# EAGLE design base-station (EAGLE 8.1.0)
REVISION: v2.0; TEAM: RoboCup
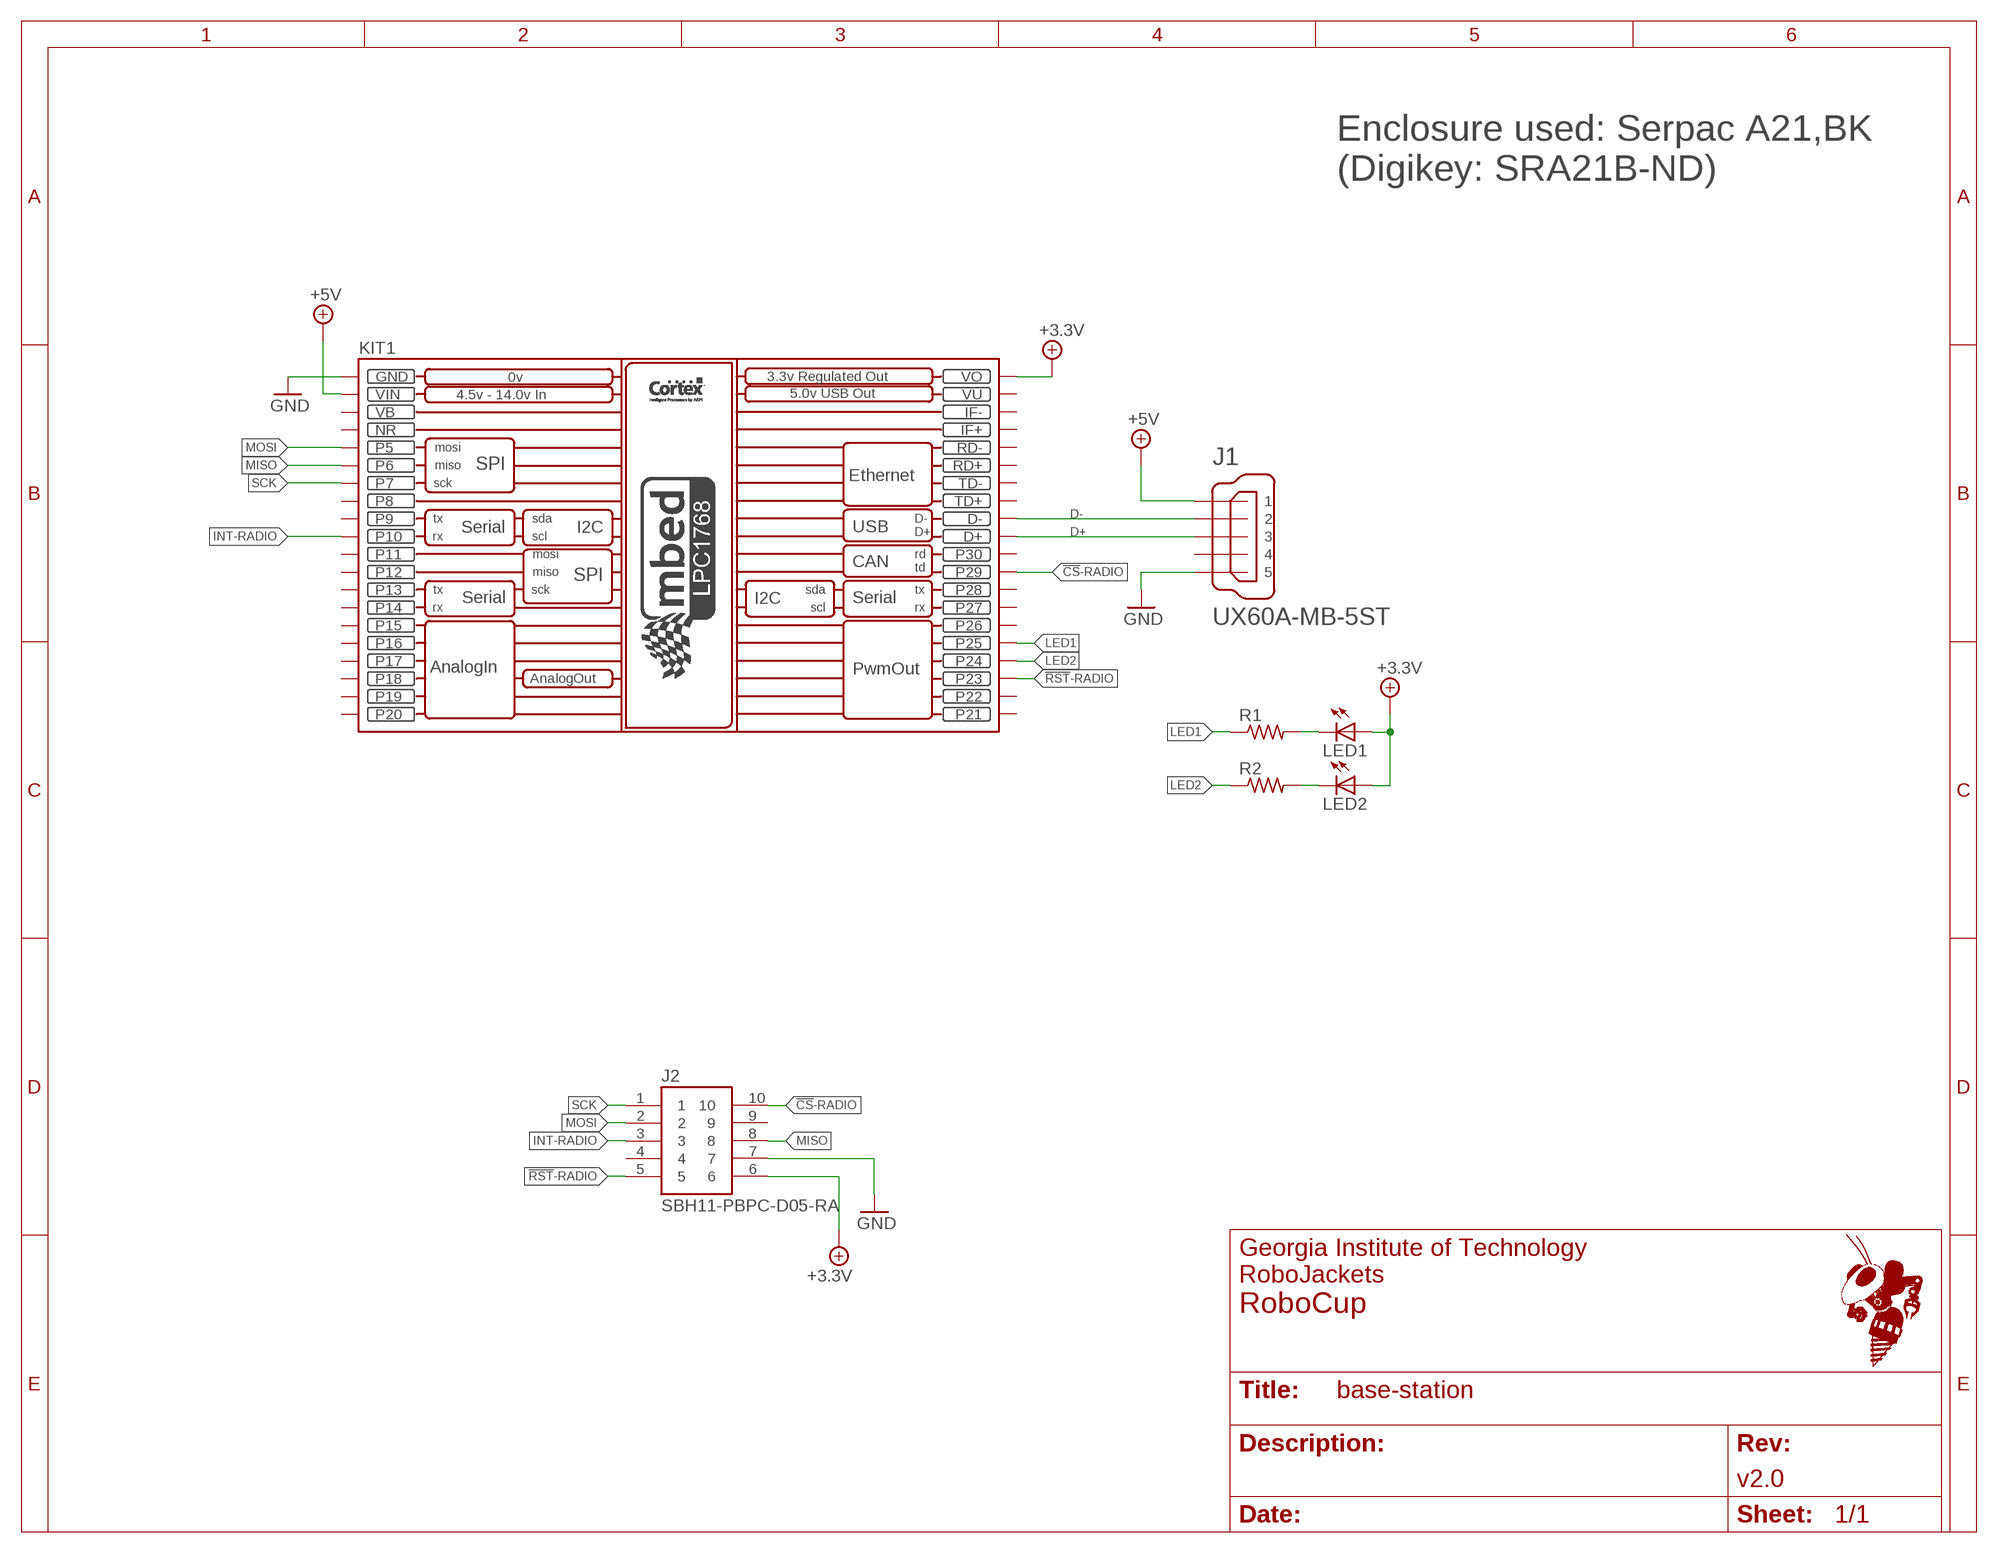
[diagram p0: schematic, sheet 1]
FRAME1 (FRAME_A_L): SCH_DESC: Base station

## Parts
J1  UX60A-MB-5ST  [UX60A-MB-5ST]
J2  SBH11-PBPC-D05-RA  [SBH11-*-D05-RA]
KIT1  MBED_NXP_LPC1768  [MBED-KIT]
LED1  LED3MM  [LED3MM]
LED2  LED3MM  [LED3MM]
R1  R-US_R0603  [R0603]
R2  R-US_R0603  [R0603]

## Nets
!CS!-RADIO: J2.10 KIT1.P$29(P29)
!RST!-RADIO: J2.5 KIT1.P$23(P23)
+3.3V: J2.6 KIT1.VOUT(VO) LED1.A LED2.A
+5V: J1.1 KIT1.VIN
D+: J1.3 KIT1.D+
D-: J1.2 KIT1.D-
GND: J1.5 J2.7 KIT1.GND
INT-RADIO: J2.3 KIT1.P$10(P10)
LED1: KIT1.P$25(P25) R1.1
LED2: KIT1.P$24(P24) R2.1
MISO: J2.8 KIT1.P$6(P6)
MOSI: J2.2 KIT1.P$5(P5)
N$1: LED1.K(C) R1.2
N$2: LED2.K(C) R2.2
SCK: J2.1 KIT1.P$7(P7)
Unconnected: J1.4 J2.4 J2.9 KIT1.IF+ KIT1.IF- KIT1.NR KIT1.P$8(P8) KIT1.P$9(P9) KIT1.P$11(P11) KIT1.P$12(P12) KIT1.P$13(P13) KIT1.P$14(P14) KIT1.P$15(P15) KIT1.P$16(P16) KIT1.P$17(P17) KIT1.P$18(P18) KIT1.P$19(P19) KIT1.P$20(P20) KIT1.P$21(P21) KIT1.P$22(P22) KIT1.P$26(P26) KIT1.P$27(P27) KIT1.P$28(P28) KIT1.P$30(P30) KIT1.RD+ KIT1.RD- KIT1.TD+ KIT1.TD-

## Notes on the sheet
- Enclosure used: Serpac A21,BK
  (Digikey: SRA21B-ND)

## Power pins joined to a net without a drawn wire
VB: KIT1.VB
VU: KIT1.VU

## Library data of the parts
J1 = RoboJackets-Connectors:UX60*-MB-5S?: Mini USB Connector Brand: Hirose Electric Co Ltd <http://www.hirose.com/us/> Series: UX <http://www.digikey.com/product-search/en?FV=fff40016,fff802e4,ffec3225> Distributor: Digi-Key <http://www.digikey.com/product-detail/en/UX60A-MB-5ST/H2961CT-ND/597540>; PINS: 5
J2 = RoboJackets-Connectors:SBH11-*-D05-?; DIGIKEY: S9177-ND; MPN: SBH11-PBPC-D05-RA-BK
KIT1 = RoboJackets-Boards:MBED_NXP_LPC1768: Mbed LPC1768 - ARM CORTEX v2.1 * Schematic symbol is now placed in eagles's default raster. *The pads diameter are suitable for routing between mbed pins * mbed pads are 0.8 mm drill diameter. --------------------------------------------- Created by: Mohamed Yousry *Alexandria, Egypt *Email: mohamed.yousry@ieeegoldegypt.org
LED1 LED2 = led:LED: LED OSRAM: - CHIPLED LG R971, LG N971, LY N971, LG Q971, LY Q971, LO R971, LY R971 LH N974, LH R974 LS Q976, LO Q976, LY Q976 LO Q996 - Hyper CHIPLED LW Q18S LB Q993, LB Q99A, LB R99A - SideLED LS A670, LO A670, LY A670, LG A670, LP A670 LB A673, LV A673, LT A673, LW A673 LH A674 LY A675 LS A676, LA A676, LO A676, LY A676, LW A676 LS A679, LY A679, LG A679 - Hyper Micro SIDELED® LS Y876, LA Y876, LO Y876, LY Y876 LT Y87S - SmartLED LW L88C, LW L88S LB L89C, LB L89S, LG L890 LS L89K, LO L89K, LY L89K LS L896, LA L896, LO L896, LY L896 - TOPLED LS T670, LO T670, LY T670, LG T670, LP T670 LSG T670, LSP T670, LSY T670, LOP T670, LYG T670 LG T671, LOG T671, LSG T671 LB T673, LV T673, LT T673, LW T673 LH T674 LS T676, LA T676, LO T676, LY T676, LB T676, LH T676, LSB T676, LW T676 LB T67C, LV T67C, LT T67C, LS T67K, LO T67K, LY T67K, LW E67C LS E67B, LA E67B, LO E67B, LY E67B, LB E67C, LV E67C, LT E67C LW T67C LS T679, LY T679, LG T679 LS T770, LO T770, LY T770, LG T770, LP T770 LB T773, LV T773, LT T773, LW T773 LH T774 LS E675, LA E675, LY E675, LS T675 LS T776, LA T776, LO T776, LY T776, LB T776 LHGB T686 LT T68C, LB T68C - Hyper Mini TOPLED® LB M676 - Mini TOPLED Santana® LG M470 LS M47K, LO M47K, LY M47K Source: http://www.osram.convergy.de LUXEON: - LUMILED® LXK2-PW12-R00, LXK2-PW12-S00, LXK2-PW14-U00, LXK2-PW14-V00 LXK2-PM12-R00, LXK2-PM12-S00, LXK2-PM14-U00 LXK2-PE12-Q00, LXK2-PE12-R00, LXK2-PE12-S00, LXK2-PE14-T00, LXK2-PE14-U00 LXK2-PB12-K00, LXK2-PB12-L00, LXK2-PB12-M00, LXK2-PB14-N00, LXK2-PB14-P00, LXK2-PB14-Q00 LXK2-PR12-L00, LXK2-PR12-M00, LXK2-PR14-Q00, LXK2-PR14-R00 LXK2-PD12-Q00, LXK2-PD12-R00, LXK2-PD12-S00 LXK2-PH12-R00, LXK2-PH12-S00 LXK2-PL12-P00, LXK2-PL12-Q00, LXK2-PL12-R00 Source: www.luxeon.com KINGBRIGHT: KA-3528ASYC Source: www.kingbright.com
R1 R2 = resistor:R-US_: RESISTOR, American symbol

## Board
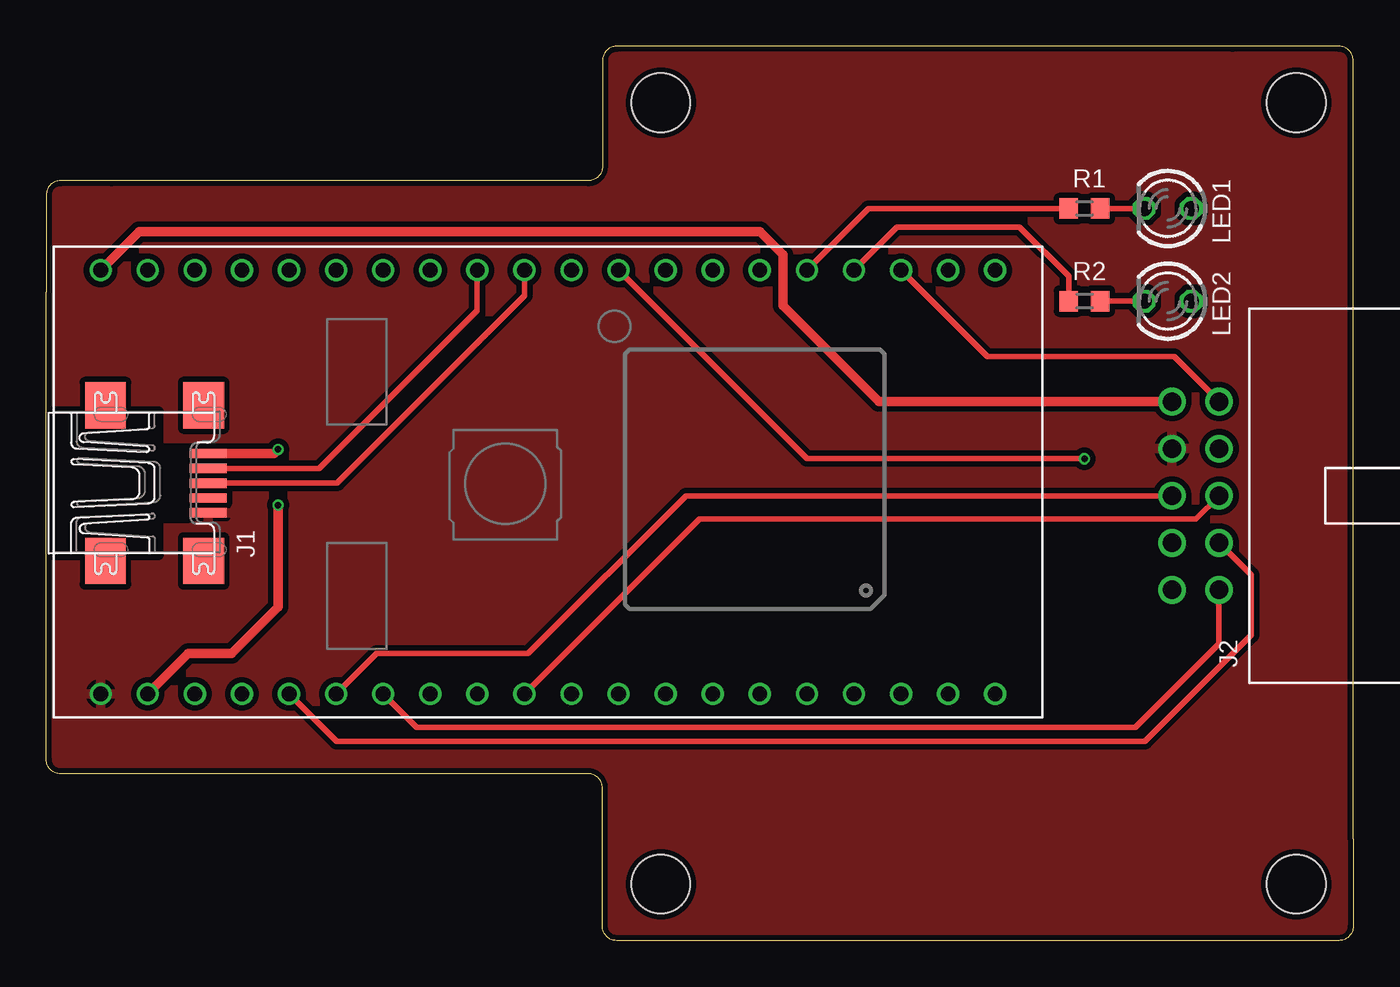
[diagram p1: board, top side]
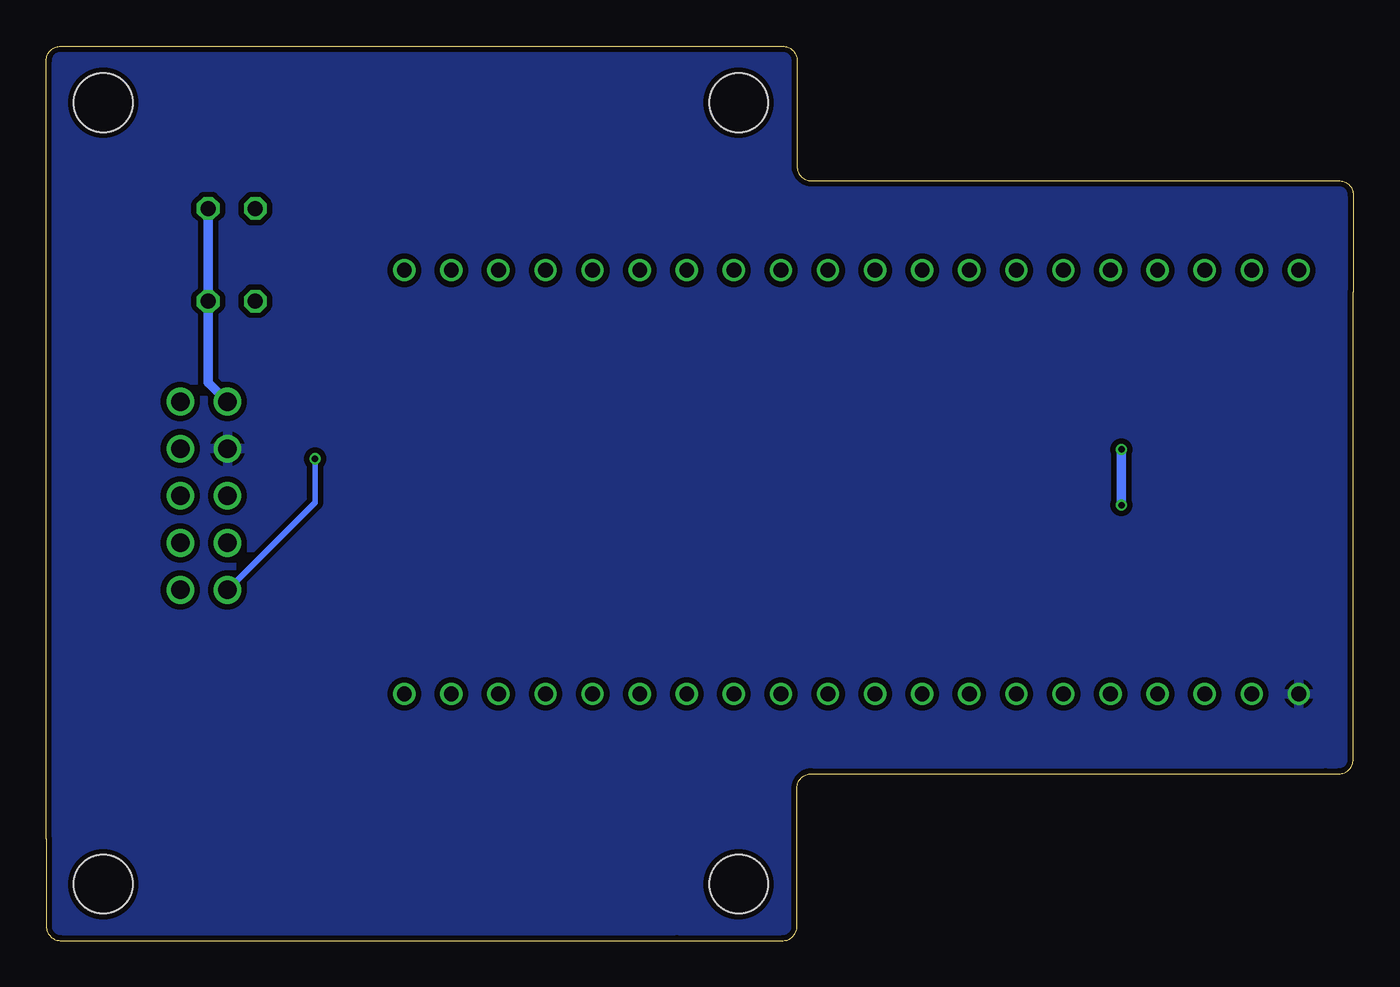
[diagram p2: board, bottom side, seen from below]

Size 70.5 x 48.25 mm. Coordinates in mm from the lower left corner, seen from the top.
Outline: 70.5,5.5 70.5,0.76 arc-90 69.74,0 36.5,0 30.76,0 arc-90 30,0.76 30,8 30,8.24 arc90 29.24,9 1.5,9 0.76,9 arc-90 0,9.76 0,35 0,40.24 arc-90 0.76,41 3.5,41 29.24,41 arc90 30,41.76 30,46 30,47.49 arc-90 30.76,48.25 64,48.25 69.74,48.25 arc-90 70.5,47.49 70.5,5.5
Copper layers (1*16): Top 0.018mm / dielectric 1.55mm / Bottom 0.018mm
Design rules "eC_2Layer_PClass6_BaseCopperO18_eCDefault": minimum track width 0.15mm, minimum drill 0.35mm, track to track 0.15mm, track to pad 0.15mm, pad to pad 0.15mm, via to via 0.15mm, smd to smd 0mil, copper to edge 0.25mm, drill to drill 0.35mm, minimum pad ring 0.175mm, minimum via ring 0.125mm, stop-mask expansion 0mil, vias tented up to drill 0.45mm, thermal gap 0.2mm
Holes 3.17 mm at 33.15,3.05 33.15,45.21 67.44,45.21 67.44,3.05

### Footprints (pad centres in the part's own frame; a part is rotated, then mirrored left to right if it is on the bottom)
UX60A-MB-5ST = smd 2 x 0.5: 1 2.25,1.6; 2 2.25,0.8; 3 2.25,0; 4 2.25,-0.8; 5 2.25,-1.6 | smd 2.2 x 2.5: M1 -3.3,-4.2; M2 -3.3,4.2; M3 2,4.2; M4 2,-4.2
SBH11-*-D05-RA = drill 1: 1 -5.08,-1.27; 2 -2.54,-1.27; 3 0,-1.27; 4 2.54,-1.27; 5 5.08,-1.27; 6 5.08,1.27; 7 2.54,1.27; 8 0,1.27; 9 -2.54,1.27; 10 -5.08,1.27
MBED-KIT = drill 0.8: D+ 11.43,1.27; D- 11.43,3.81; GND -11.43,24.13; IF+ 11.43,16.51; IF- 11.43,19.05; NR -11.43,16.51; P$5 -11.43,13.97; P$6 -11.43,11.43; P$7 -11.43,8.89; P$8 -11.43,6.35; P$9 -11.43,3.81; P$10 -11.43,1.27; P$11 -11.43,-1.27; P$12 -11.43,-3.81; P$13 -11.43,-6.35; P$14 -11.43,-8.89; P$15 -11.43,-11.43; P$16 -11.43,-13.97; P$17 -11.43,-16.51; P$18 -11.43,-19.05; P$19 -11.43,-21.59; P$20 -11.43,-24.13; P$21 11.43,-24.13; P$22 11.43,-21.59; P$23 11.43,-19.05; P$24 11.43,-16.51; P$25 11.43,-13.97; P$26 11.43,-11.43; P$27 11.43,-8.89; P$28 11.43,-6.35; P$29 11.43,-3.81; P$30 11.43,-1.27; RD+ 11.43,11.43; RD- 11.43,13.97; TD+ 11.43,6.35; TD- 11.43,8.89; VB -11.43,19.05; VIN -11.43,21.59; VOUT 11.43,24.13; VU 11.43,21.59
LED3MM = drill 0.813 octagon: A -1.27,0; K 1.27,0
R0603 = smd 1 x 1.1: 1 -0.85,0; 2 0.85,0

### Placement (x,y rotation side)
J1  6.49,24.68 0 top
J2  62,24 90 top
KIT1  27.06,24.74 90 top
LED1  60.5,39.5 180 top
LED2  60.5,34.5 180 top
R1  56,39.5 0 top
R2  56,34.5 0 top

### Tracks (layer width: path | path; a pad name or v marks a point on that pad's centre or on a via)
!CS!-RADIO  (via drill 0.35)
  Top 0.3: KIT1.P$29 41.04,26 v56,26
  Bottom 0.3: v56,26 56,23.65 J2.10
!RST!-RADIO
  Top 0.3: KIT1.P$23 50.78,31.5 60.85,31.5 J2.5
+3.3V
  Top 0.5: KIT1.VOUT 5.01,38.25 38.5,38.25 39.75,37 39.75,34.25 44.92,29.08 J2.6
  Bottom 0.5: LED1.A LED2.A 61.77,30.12 J2.6
+5V  (via drill 0.35)
  Top 0.5: KIT1.VIN 7.66,15.5 10,15.5 12.5,18 v12.5,23.5 | v12.5,26.5 12.28,26.28 J1.1
  Bottom 0.5: v12.5,23.5 v12.5,26.5
D+
  Top 0.3: J1.3 15.68,24.68 25.79,34.79 KIT1.D+
D-
  Top 0.3: J1.2 14.73,25.48 23.25,34 KIT1.D-
GND
  pour Top (isolate 0.3): 0,0 0,48.26 70.48,48.26 70.48,0
  pour Bottom (isolate 0.3): 0,0 0,48.26 70.48,48.26 70.48,0
INT-RADIO
  Top 0.3: KIT1.P$10 35.23,22.75 62.02,22.75 J2.3
LED1
  Top 0.3: KIT1.P$25 44.36,39.5 R1.1
LED2
  Top 0.3: KIT1.P$24 45.9,38.5 52.5,38.5 55.15,35.85 R2.1
MISO
  Top 0.3: KIT1.P$6 17.82,15.5 26,15.5 34.5,24 J2.8
MOSI
  Top 0.3: KIT1.P$5 15.65,10.75 59.25,10.75 65,16.5 65,19.73 J2.2
N$1
  Top 0.3: R1.2 LED1.K
N$2
  Top 0.3: R2.2 LED2.K
SCK
  Top 0.3: KIT1.P$7 19.98,11.5 58.75,11.5 63.25,16 63.25,18.9 J2.1